# Altium schematic sheet RK3568-VI-Interface-Sheet.SchDoc
size 420 x 297 mm; SheetNumber: 10; SheetTotal: 25
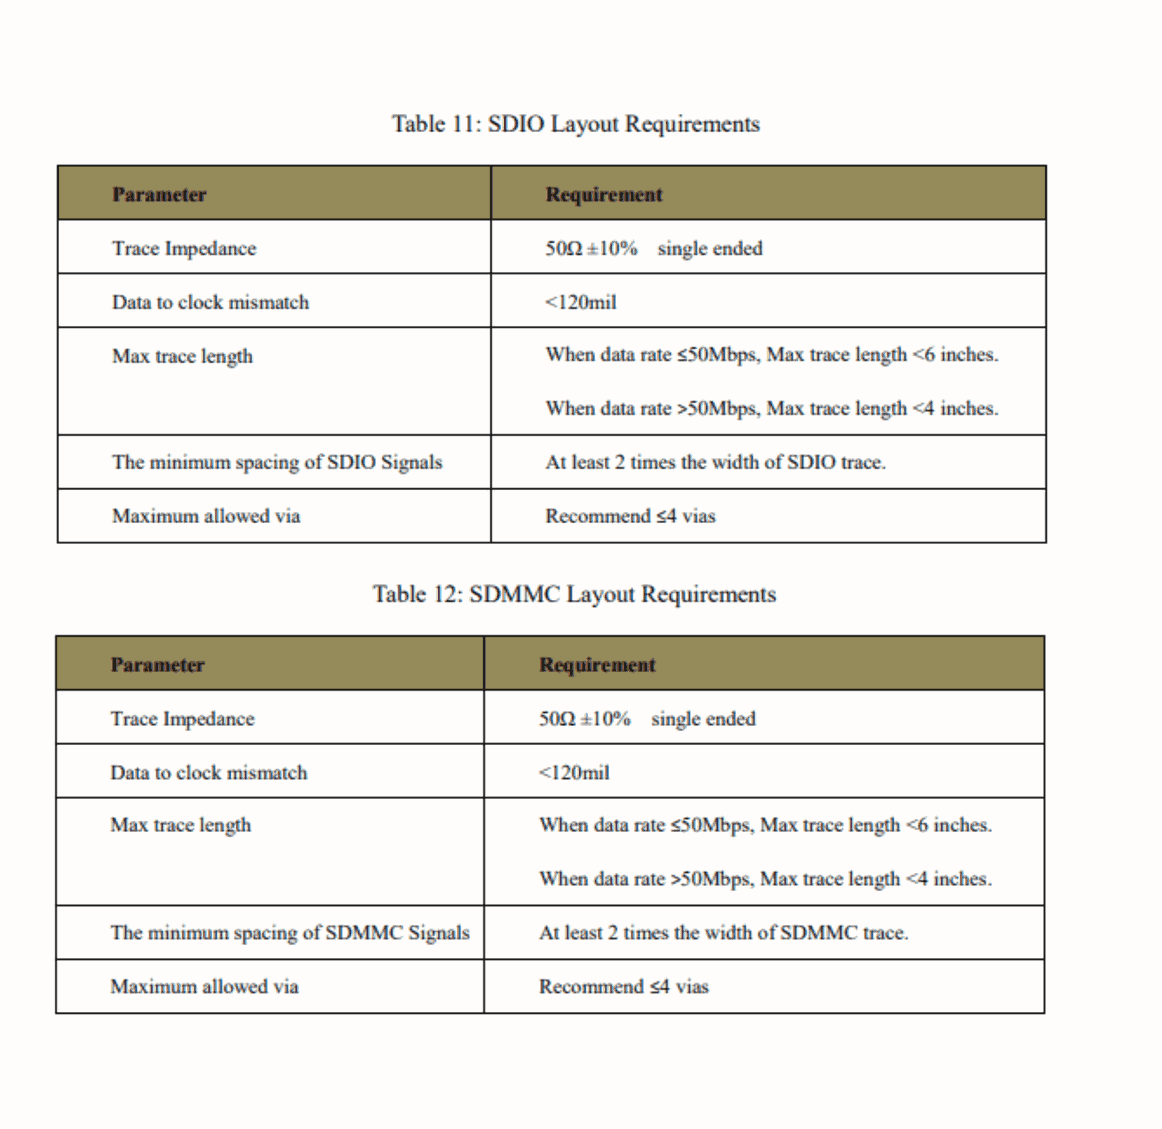
[diagram p0: RK3568-VI-Interface-Sheet.SchDoc, left]
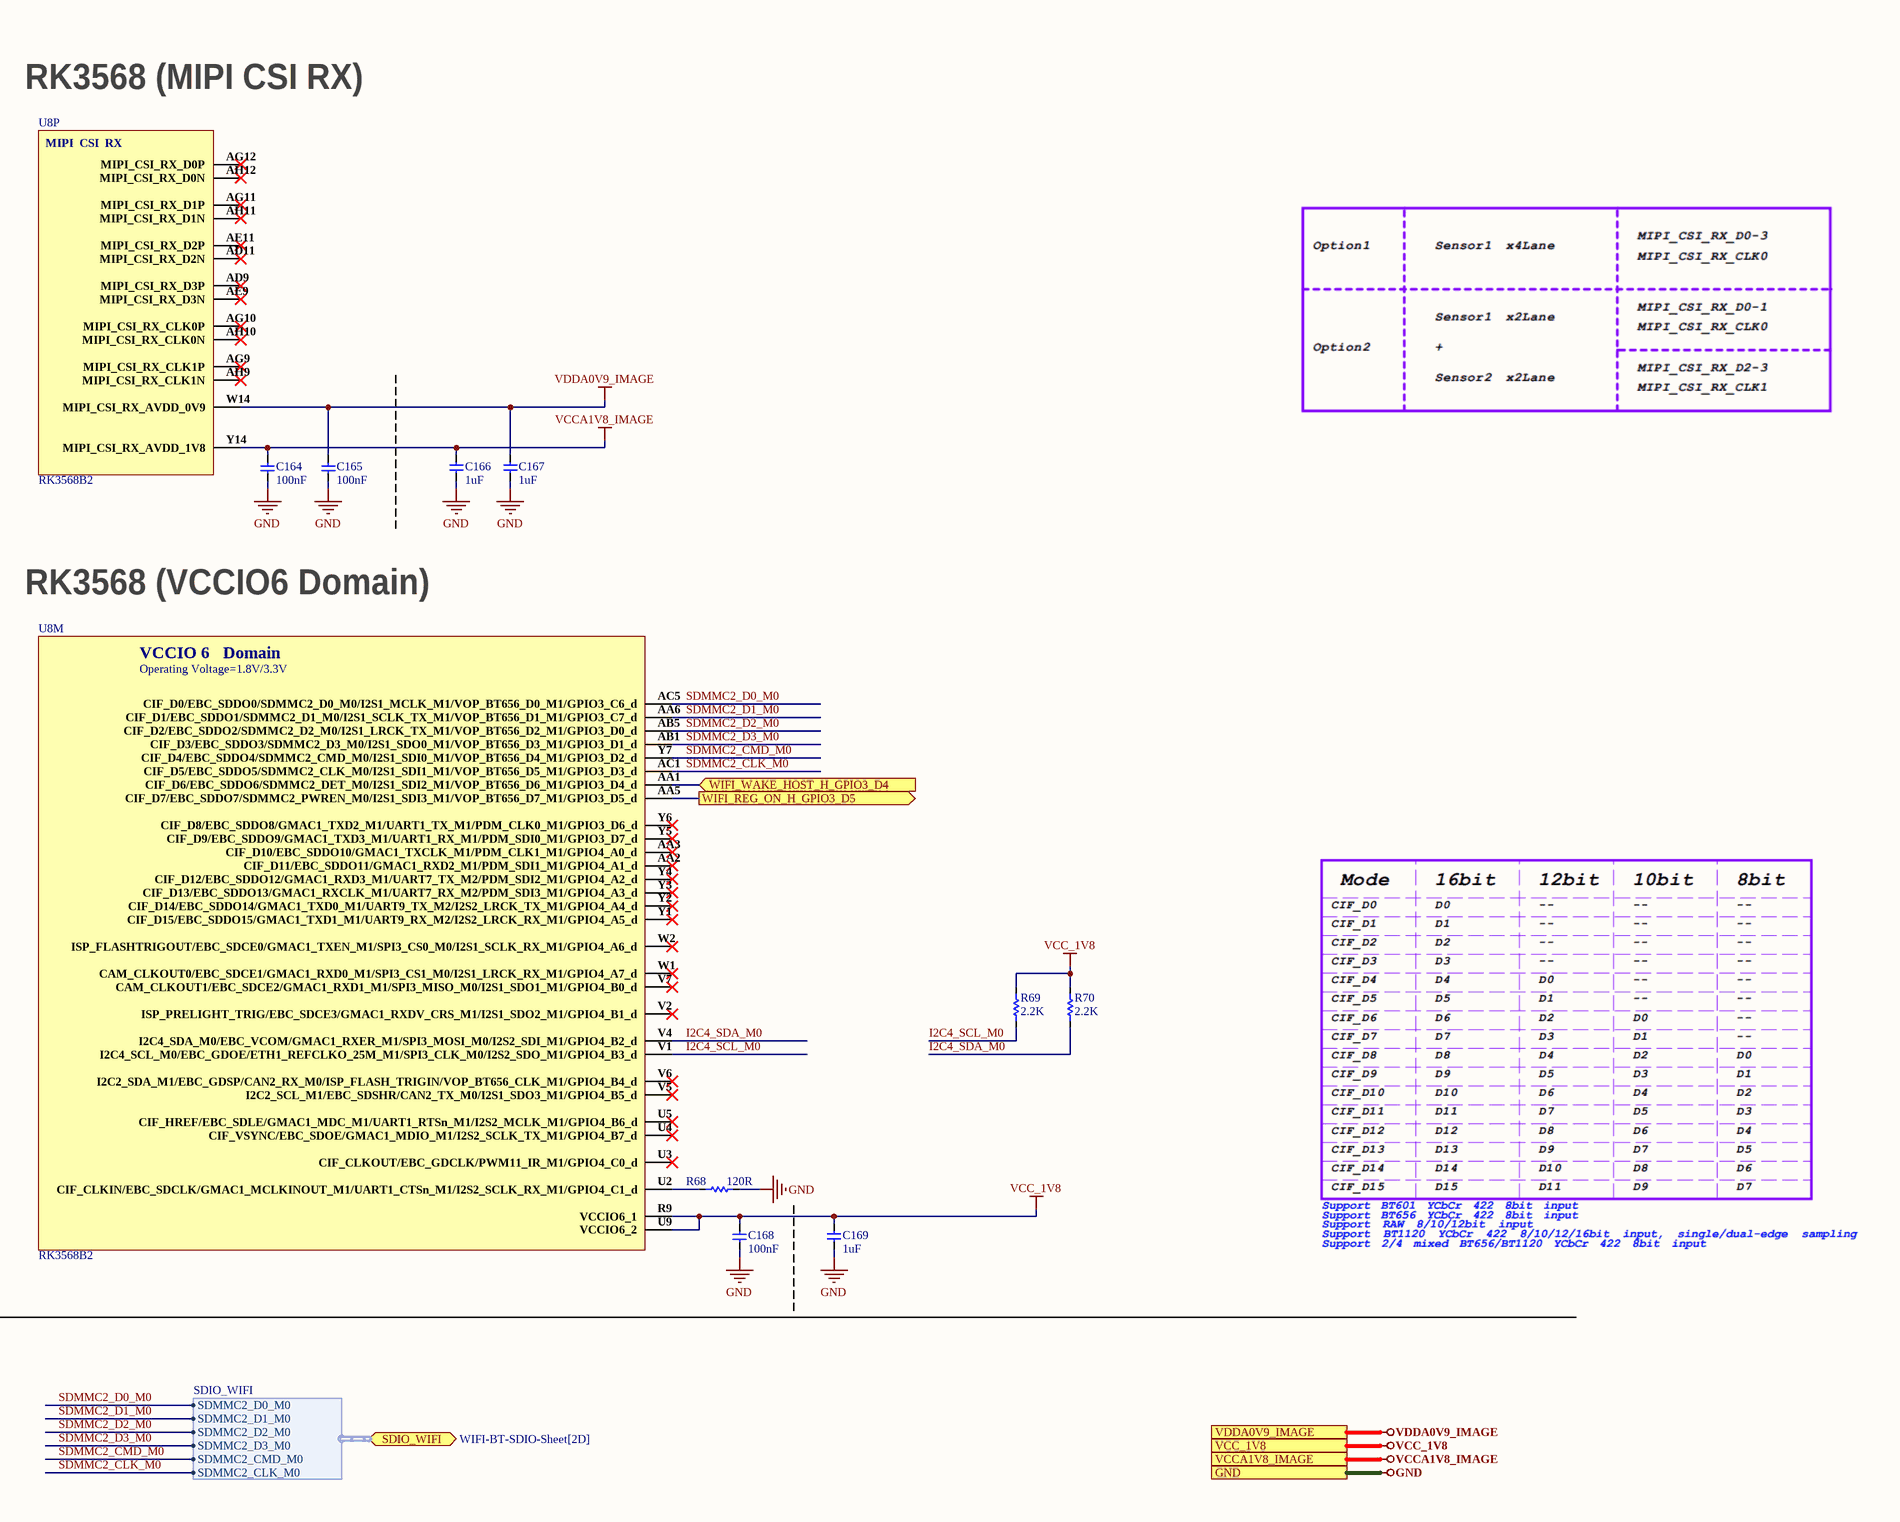
[diagram p1: RK3568-VI-Interface-Sheet.SchDoc, right]

## Parts
C164  100nF  [CAP-0201]
C165  100nF  [CAP-0201]
C166  1uF  [Cap-0402]
C167  1uF  [Cap-0402]
C168  100nF  [CAP-0201]
C169  1uF  [Cap-0402]
R68  120R  [Res-0201]
R69  2.2K  [Res-0402]
R70  2.2K  [Res-0402]
U8  RK3568B2  [FCCSP-636L]  (parts M,P of 23)

## Ports
GND (see Connector-Sheet[5D], DRAM-LPDDR4x-Sheet[4D], eMMC-Sheet[4D], LED-Debug-Sheet[4D], MicroSD-SPI-Flash-Sheet[4D], Power-DC-IN-Sheet[4D], Power-Others-Sheet[4D], Power-PMIC-Sheet[4D], RK3568-Audio-Interface[4D], RK3568-Flash-SD-Controller[4D], RK3568-OSC-PMUIO-Sheet[5D], RK3568-Power-Sheet[4D], RK3568-SARADC-GPIO[4D], RK3568-USB-PCIe-Sheet[5D], RK3568-VO-Interface-1[4D], RK3568-VO-Interface-2[4D], Sensors-Sheet-1[4D], Sensors-Sheet-2[5D], Type-C-Sheet[4D], USB-Ports[4D], VO-HDMI2.0-TX-Sheet[4D], VO-LCM-MIPI-DSI-TX0[4D], WIFI-BT-SDIO-Sheet[4D]), SDIO_WIFI (bidir, harness SDIO_WIFI, see WIFI-BT-SDIO-Sheet[2D]), VCC_1V8 (see Power-Others-Sheet[4D], Power-PMIC-Sheet[4D], RK3568-SARADC-GPIO[4D], WIFI-BT-SDIO-Sheet[4D]), VCCA1V8_IMAGE (see Power-PMIC-Sheet[4D], RK3568-VO-Interface-1[4D]), VDDA0V9_IMAGE (see Power-PMIC-Sheet[3D], RK3568-VO-Interface-1[4D]), WIFI_REG_ON_H_GPIO3_D5 (out, see WIFI-BT-SDIO-Sheet[2B]), WIFI_WAKE_HOST_H_GPIO3_D4 (in, see WIFI-BT-SDIO-Sheet[2B])

## Harnesses
SDIO_WIFI: SDMMC2_D0_M0, SDMMC2_D1_M0, SDMMC2_D2_M0, SDMMC2_D3_M0, SDMMC2_CMD_M0, SDMMC2_CLK_M0

## Nets
GND: C164.1 C165.1 C166.2 C167.2 C168.1 C169.2 R68.2 ; port GND
VCC_1V8: C168.2 C169.1 R69.2 R70.2 U8.R9(VCCIO6_1) U8.U9(VCCIO6_2) ; port VCC_1V8
VCCA1V8_IMAGE: C164.2 C166.1 U8.Y14(MIPI_CSI_RX_AVDD_1V8) ; port VCCA1V8_IMAGE
VDDA0V9_IMAGE: C165.2 C167.1 U8.W14(MIPI_CSI_RX_AVDD_0V9) ; port VDDA0V9_IMAGE
I2C4_SCL_M0: R69.1 U8.V1(I2C4_SCL_M0/EBC_GDOE/ETH1_REFCLKO_25M_M1/SPI3_CLK_M0/I2S2_SDO_M1/GPIO4_B3_d)
I2C4_SDA_M0: R70.1 U8.V4(I2C4_SDA_M0/EBC_VCOM/GMAC1_RXER_M1/SPI3_MOSI_M0/I2S2_SDI_M1/GPIO4_B2_d)
SDMMC2_CLK_M0: U8.AC1(CIF_D5/EBC_SDDO5/SDMMC2_CLK_M0/I2S1_SDI1_M1/VOP_BT656_D5_M1/GPIO3_D3_d) ; port SDIO_WIFI.SDMMC2_CLK_M0
SDMMC2_CMD_M0: U8.Y7(CIF_D4/EBC_SDDO4/SDMMC2_CMD_M0/I2S1_SDI0_M1/VOP_BT656_D4_M1/GPIO3_D2_d) ; port SDIO_WIFI.SDMMC2_CMD_M0
SDMMC2_D0_M0: U8.AC5(CIF_D0/EBC_SDDO0/SDMMC2_D0_M0/I2S1_MCLK_M1/VOP_BT656_D0_M1/GPIO3_C6_d) ; port SDIO_WIFI.SDMMC2_D0_M0
SDMMC2_D1_M0: U8.AA6(CIF_D1/EBC_SDDO1/SDMMC2_D1_M0/I2S1_SCLK_TX_M1/VOP_BT656_D1_M1/GPIO3_C7_d) ; port SDIO_WIFI.SDMMC2_D1_M0
SDMMC2_D2_M0: U8.AB5(CIF_D2/EBC_SDDO2/SDMMC2_D2_M0/I2S1_LRCK_TX_M1/VOP_BT656_D2_M1/GPIO3_D0_d) ; port SDIO_WIFI.SDMMC2_D2_M0
SDMMC2_D3_M0: U8.AB1(CIF_D3/EBC_SDDO3/SDMMC2_D3_M0/I2S1_SDO0_M1/VOP_BT656_D3_M1/GPIO3_D1_d) ; port SDIO_WIFI.SDMMC2_D3_M0
WIFI_REG_ON_H_GPIO3_D5: U8.AA5(CIF_D7/EBC_SDDO7/SDMMC2_PWREN_M0/I2S1_SDI3_M1/VOP_BT656_D7_M1/GPIO3_D5_d) ; port WIFI_REG_ON_H_GPIO3_D5
WIFI_WAKE_HOST_H_GPIO3_D4: U8.AA1(CIF_D6/EBC_SDDO6/SDMMC2_DET_M0/I2S1_SDI2_M1/VOP_BT656_D6_M1/GPIO3_D4_d) ; port WIFI_WAKE_HOST_H_GPIO3_D4
NetR68_1: R68.1 U8.U2(CIF_CLKIN/EBC_SDCLK/GMAC1_MCLKINOUT_M1/UART1_CTSn_M1/I2S2_SCLK_RX_M1/GPIO4_C1_d)

Not connected (* = marked no-connect by the designer): U8 AA2(CIF_D11/EBC_SDDO11/GMAC1_RXD2_M1/PDM_SDI1_M1/GPIO4_A1_d)* AA3(CIF_D10/EBC_SDDO10/GMAC1_TXCLK_M1/PDM_CLK1_M1/GPIO4_A0_d)* AD9(MIPI_CSI_RX_D3P)* AD11(MIPI_CSI_RX_D2N)* AE9(MIPI_CSI_RX_D3N)* AE11(MIPI_CSI_RX_D2P)* AG9(MIPI_CSI_RX_CLK1P)* AG10(MIPI_CSI_RX_CLK0P)* AG11(MIPI_CSI_RX_D1P)* AG12(MIPI_CSI_RX_D0P)* AH9(MIPI_CSI_RX_CLK1N)* AH10(MIPI_CSI_RX_CLK0N)* AH11(MIPI_CSI_RX_D1N)* AH12(MIPI_CSI_RX_D0N)* U3(CIF_CLKOUT/EBC_GDCLK/PWM11_IR_M1/GPIO4_C0_d)* U4(CIF_VSYNC/EBC_SDOE/GMAC1_MDIO_M1/I2S2_SCLK_TX_M1/GPIO4_B7_d)* U5(CIF_HREF/EBC_SDLE/GMAC1_MDC_M1/UART1_RTSn_M1/I2S2_MCLK_M1/GPIO4_B6_d)* V2(ISP_PRELIGHT_TRIG/EBC_SDCE3/GMAC1_RXDV_CRS_M1/I2S1_SDO2_M1/GPIO4_B1_d)* V5(I2C2_SCL_M1/EBC_SDSHR/CAN2_TX_M0/I2S1_SDO3_M1/GPIO4_B5_d)* V6(I2C2_SDA_M1/EBC_GDSP/CAN2_RX_M0/ISP_FLASH_TRIGIN/VOP_BT656_CLK_M1/GPIO4_B4_d)* V7(CAM_CLKOUT1/EBC_SDCE2/GMAC1_RXD1_M1/SPI3_MISO_M0/I2S1_SDO1_M1/GPIO4_B0_d)* W1(CAM_CLKOUT0/EBC_SDCE1/GMAC1_RXD0_M1/SPI3_CS1_M0/I2S1_LRCK_RX_M1/GPIO4_A7_d)* W2(ISP_FLASHTRIGOUT/EBC_SDCE0/GMAC1_TXEN_M1/SPI3_CS0_M0/I2S1_SCLK_RX_M1/GPIO4_A6_d)* Y1(CIF_D15/EBC_SDDO15/GMAC1_TXD1_M1/UART9_RX_M2/I2S2_LRCK_RX_M1/GPIO4_A5_d)* Y2(CIF_D14/EBC_SDDO14/GMAC1_TXD0_M1/UART9_TX_M2/I2S2_LRCK_TX_M1/GPIO4_A4_d)* Y3(CIF_D13/EBC_SDDO13/GMAC1_RXCLK_M1/UART7_RX_M2/PDM_SDI3_M1/GPIO4_A3_d)* Y4(CIF_D12/EBC_SDDO12/GMAC1_RXD3_M1/UART7_TX_M2/PDM_SDI2_M1/GPIO4_A2_d)* Y5(CIF_D9/EBC_SDDO9/GMAC1_TXD3_M1/UART1_RX_M1/PDM_SDI0_M1/GPIO3_D7_d)* Y6(CIF_D8/EBC_SDDO8/GMAC1_TXD2_M1/UART1_TX_M1/PDM_CLK0_M1/GPIO3_D6_d)*

## Notes on the sheet
- RK3568 (MIPI CSI RX)
- RK3568 (VCCIO6 Domain)
- File:
- Title:
- Date:
- Page
- Num:
- Total:
- Drawn By: Huzaifa Ali
- (in symbol RK3568B2, part M) VCCIO 6   Domain; Operating Voltage=1.8V/3.3V
- (in symbol RK3568B2, part P) MIPI  CSI  RX

## Library data of the parts
C164 C165 C168 = CC0201KRX5R6BB104: CAP CER 0.1UF 10V X5R 0201; Manufacturer: Yageo; Tolerance: 10%; Supplier 1: Mouser; Manufacturer Part Number: CC0201KRX5R6BB104; RoHS: Yes; Category: Ceramic Capacitors; Stock 1: 824403; Pricing 1: 1=0.10000, 10=0.02400, 50=0.02400, 100=0.01900, 1000=0.01100, 10000=0.00900 (USD); Mount: Surface Mount; Case/Package: 0201; Case Code (Imperial): 0201; Case Code (Metric): 0603; Weight: 6E-06oz; Min Operating Temperature: -55°C; Max Operating Temperature: 85°C; Capacitance: 100nF; Dielectric: X5R; Voltage Rating (DC): 10V; Packaging: Tape and Reel; Termination: SMD/SMT; Resistor Type: Ceramic; Voltage Rating: 10V; Series: CC; Construction: Flat; Length: 0.6mm; Width: 0.012inch; Height: 0.3mm; Thickness: 0.013inch; Depth: 0.3mm; Radiation Hardening: No; Lead Free: Lead Free; Halogen Free: Halogen Free; RoHS Compliant: Yes; ComponentLink1URL: https://datasheet.ciiva.com/11587/upy-gphc-x5r-4v-to-50v-12-11587190.pdf?src-supplier=Avnet; ComponentLink1Description: https://datasheet.ciiva.com/11587/upy-gphc-x5r-4v-to-50v-12-11587190.pdf?src-supplier=Avnet; Supplier Part Number 1: 603-CC201KRX5R6BB104; LCSC Part Number: C190183
C166 C167 C169 = CC0402KRX5R6BB105: CAP CER 1UF 10V X5R 0402; Manufacturer: Yageo; Tolerance: 10%; Dissipation Factor: 15%; Item Type: Capacitor; Supplier 1: Mouser; Manufacturer Part Number: CC0402KRX5R6BB105; RoHS: Yes; Category: Ceramic Capacitors; Stock 1: 6711367; Pricing 1: 1=0.11000, 10=0.05500, 50=0.05500, 100=0.03300, 500=0.02700, 1000=0.02200, 2500=0.02100, 10000=0.01800 (USD); Mount: Surface Mount; Case/Package: 0402; Number of Pins: 2; Case Code (Metric): 1005; Case Code (Imperial): 0402; Min Operating Temperature: -55°C; Max Operating Temperature: 85°C; Capacitance: 1uF; Dielectric: X5R; Package Quantity: 1; Voltage Rating: 10V; Packaging: Tape and Reel; Voltage Rating (DC): 10V; Termination: SMD/SMT; Resistor Type: Ceramic; Series: CC; Construction: Flat; Length: 1mm; Width: 0.02inch; Height: 0.5mm; Thickness: 0.022inch; Depth: 0.5mm; Radiation Hardening: No; REACH SVHC: No SVHC; Lead Free: Lead Free; Halogen Free: Halogen Free; RoHS Compliant: Yes; ComponentLink1URL: https://datasheet.ciiva.com/176/upy-gphc-x5r-4v-to-50v-12-176704.pdf?src-supplier=Digi-Key; ComponentLink1Description: https://datasheet.ciiva.com/176/upy-gphc-x5r-4v-to-50v-12-176704.pdf?src-supplier=Digi-Key; ComponentLink2URL: https://datasheet.ciiva.com/176/mlccorderingcode-176705.pdf?src-supplier=Digi-Key; ComponentLink2Description: https://datasheet.ciiva.com/176/mlccorderingcode-176705.pdf?src-supplier=Digi-Key; ComponentLink3URL: https://datasheet.ciiva.com/176/mlccorderingcode-176706.pdf?src-supplier=Digi-Key; ComponentLink3Description: https://datasheet.ciiva.com/176/mlccorderingcode-176706.pdf?src-supplier=Digi-Key; Supplier Part Number 1: 603-CC402KRX5R6BB105; LCSC Part Number: C106254
R68 = RC0201FR-07120RL: RES 120 OHM 1% 1/20W 0201; Manufacturer: Yageo; Item Type: Resistor; Supplier: Digikey; Supplier Part Number: 311-120MCT-ND; Manufacturer Part Number: RC0201FR-07120RL; RoHS: Yes; Category: Chip SMD Resistors; Stock: 38339; Pricing: 1=0.1, 10=0.027, 50=0.0172, 100=0.0143, 500=0.00988, 1000=0.00854, 5000=0.00629 (USD); Lead Free: 5697LeadFree; ComponentLink1URL: https://datasheet.ciiva.com/2525/pyu-r-int-thick-7-2525064.pdf?src-supplier=Digikey; ComponentLink1Description: https://datasheet.ciiva.com/2525/pyu-r-int-thick-7-2525064.pdf?src-supplier=Digikey; ComponentLink2URL: https://datasheet.ciiva.com/22661/1563626-22661285.pdf?src-supplier=Element14; ComponentLink2Description: https://datasheet.ciiva.com/22661/1563626-22661285.pdf?src-supplier=Element14; ComponentLink3URL: https://datasheet.ciiva.com/2525/pyu-r-int-thick-7-2525062.pdf?src-supplier=Digikey; ComponentLink3Description: https://datasheet.ciiva.com/2525/pyu-r-int-thick-7-2525062.pdf?src-supplier=Digikey; ComponentLink4URL: https://datasheet.ciiva.com/2525/pyu-r-int-thick-7-2525063.pdf?src-supplier=Digikey; ComponentLink4Description: https://datasheet.ciiva.com/2525/pyu-r-int-thick-7-2525063.pdf?src-supplier=Digikey; LCSC Part Number: C295718
R69 R70 = RC0402FR-072K2L: RES SMD 2.2K OHM 1% 1/16W 0402; Manufacturer: Yageo; Resistance: 2.2kR; Power Rating: 63mW; Voltage Rating: 50V; Temperature Coefficient: 100ppm/°C; Supplier 1: Digi-Key; Manufacturer Part Number: RC0402FR-072K2L; Stock 1: 966157; Pricing 1: 1=0.1, 10=0.016, 100=0.0066, 1000=0.00299, 2500=0.00259, 5000=0.00214 (USD); Case/Package: 0402; Case Code (Imperial): 0402; Case Code (Metric): 1005; Weight: 2.3E-05oz; Size Code: 0402; Min Operating Temperature: -55°C; Max Operating Temperature: 155°C; Resistor Type: Thick Film; Packaging: Tape and Reel; Tolerance: 1%; Termination: SMD/SMT; Features: Moisture Resistant; Series: RC; Max Power Dissipation: 63mW; Number of Terminations: 2; Resistance Tolerance: 1%; Construction: Rectangular; Technology: THICK FILM; Length: 1mm; Width: 0.5mm; Height: 0.35mm; Depth: 0.5mm; RoHS Compliant: Yes; REACH SVHC: Unknown; Military Standard: Not; Lead Free: Lead Free; ComponentLink1URL: http://www.farnell.com/datasheets/2167052.pdf?src-supplier=Element14; ComponentLink1Description: http://www.farnell.com/datasheets/2167052.pdf?src-supplier=Element14; ComponentLink2URL: http://www.yageo.com/documents/recent/PYu-RC_Group_51_RoHS_L_9.pdf?src-supplier=Mouser; ComponentLink2Description: http://www.yageo.com/documents/recent/PYu-RC_Group_51_RoHS_L_9.pdf?src-supplier=Mouser; ComponentLink3URL: http://documents.rs-components.com/techlib://itc_doclist_GB.htm?stockno=6186532&src-supplier=RSComponents; ComponentLink3Description: http://documents.rs-components.com/techlib://itc_doclist_GB.htm?stockno=6186532&src-supplier=RSComponents; ComponentLink4URL: http://www.yageo.com/documents/recent/PYu-RC0402_51_RoHS_L_6_r.pdf?src-supplier=Future+Electronics; ComponentLink4Description: http://www.yageo.com/documents/recent/PYu-RC0402_51_RoHS_L_6_r.pdf?src-supplier=Future+Electronics; Supplier Part Number 1: 311-2.20KLRCT-ND; LCSC Part Number: C114762
U8 = RK3568B2: FCCSP-636L Microcontroller Units (MCUs/MPUs/SOCs) ROHS; Manufacturer: Rockchip; Item Type: IC; Manufacturer Part Number: RK3568B2; Package: FCCSP-636L; LCSC Part Number: C3345225